# Altium schematic sheet 05_Connectors_Protection.SchDoc
size A; SheetNumber: 5; SheetTotal: 5
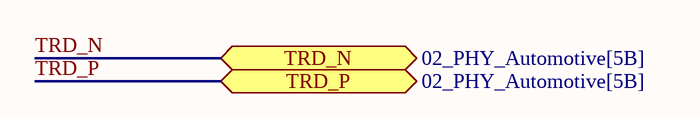
[diagram p0: 05_Connectors_Protection.SchDoc]

## Ports
TRD_N (bidir, see 02_PHY_Automotive[5B]), TRD_P (bidir, see 02_PHY_Automotive[5B])

## Nets
TRD_N: port TRD_N
TRD_P: port TRD_P